# Altium schematic sheet FE_Channel.SchDoc
size 420 x 297 mm
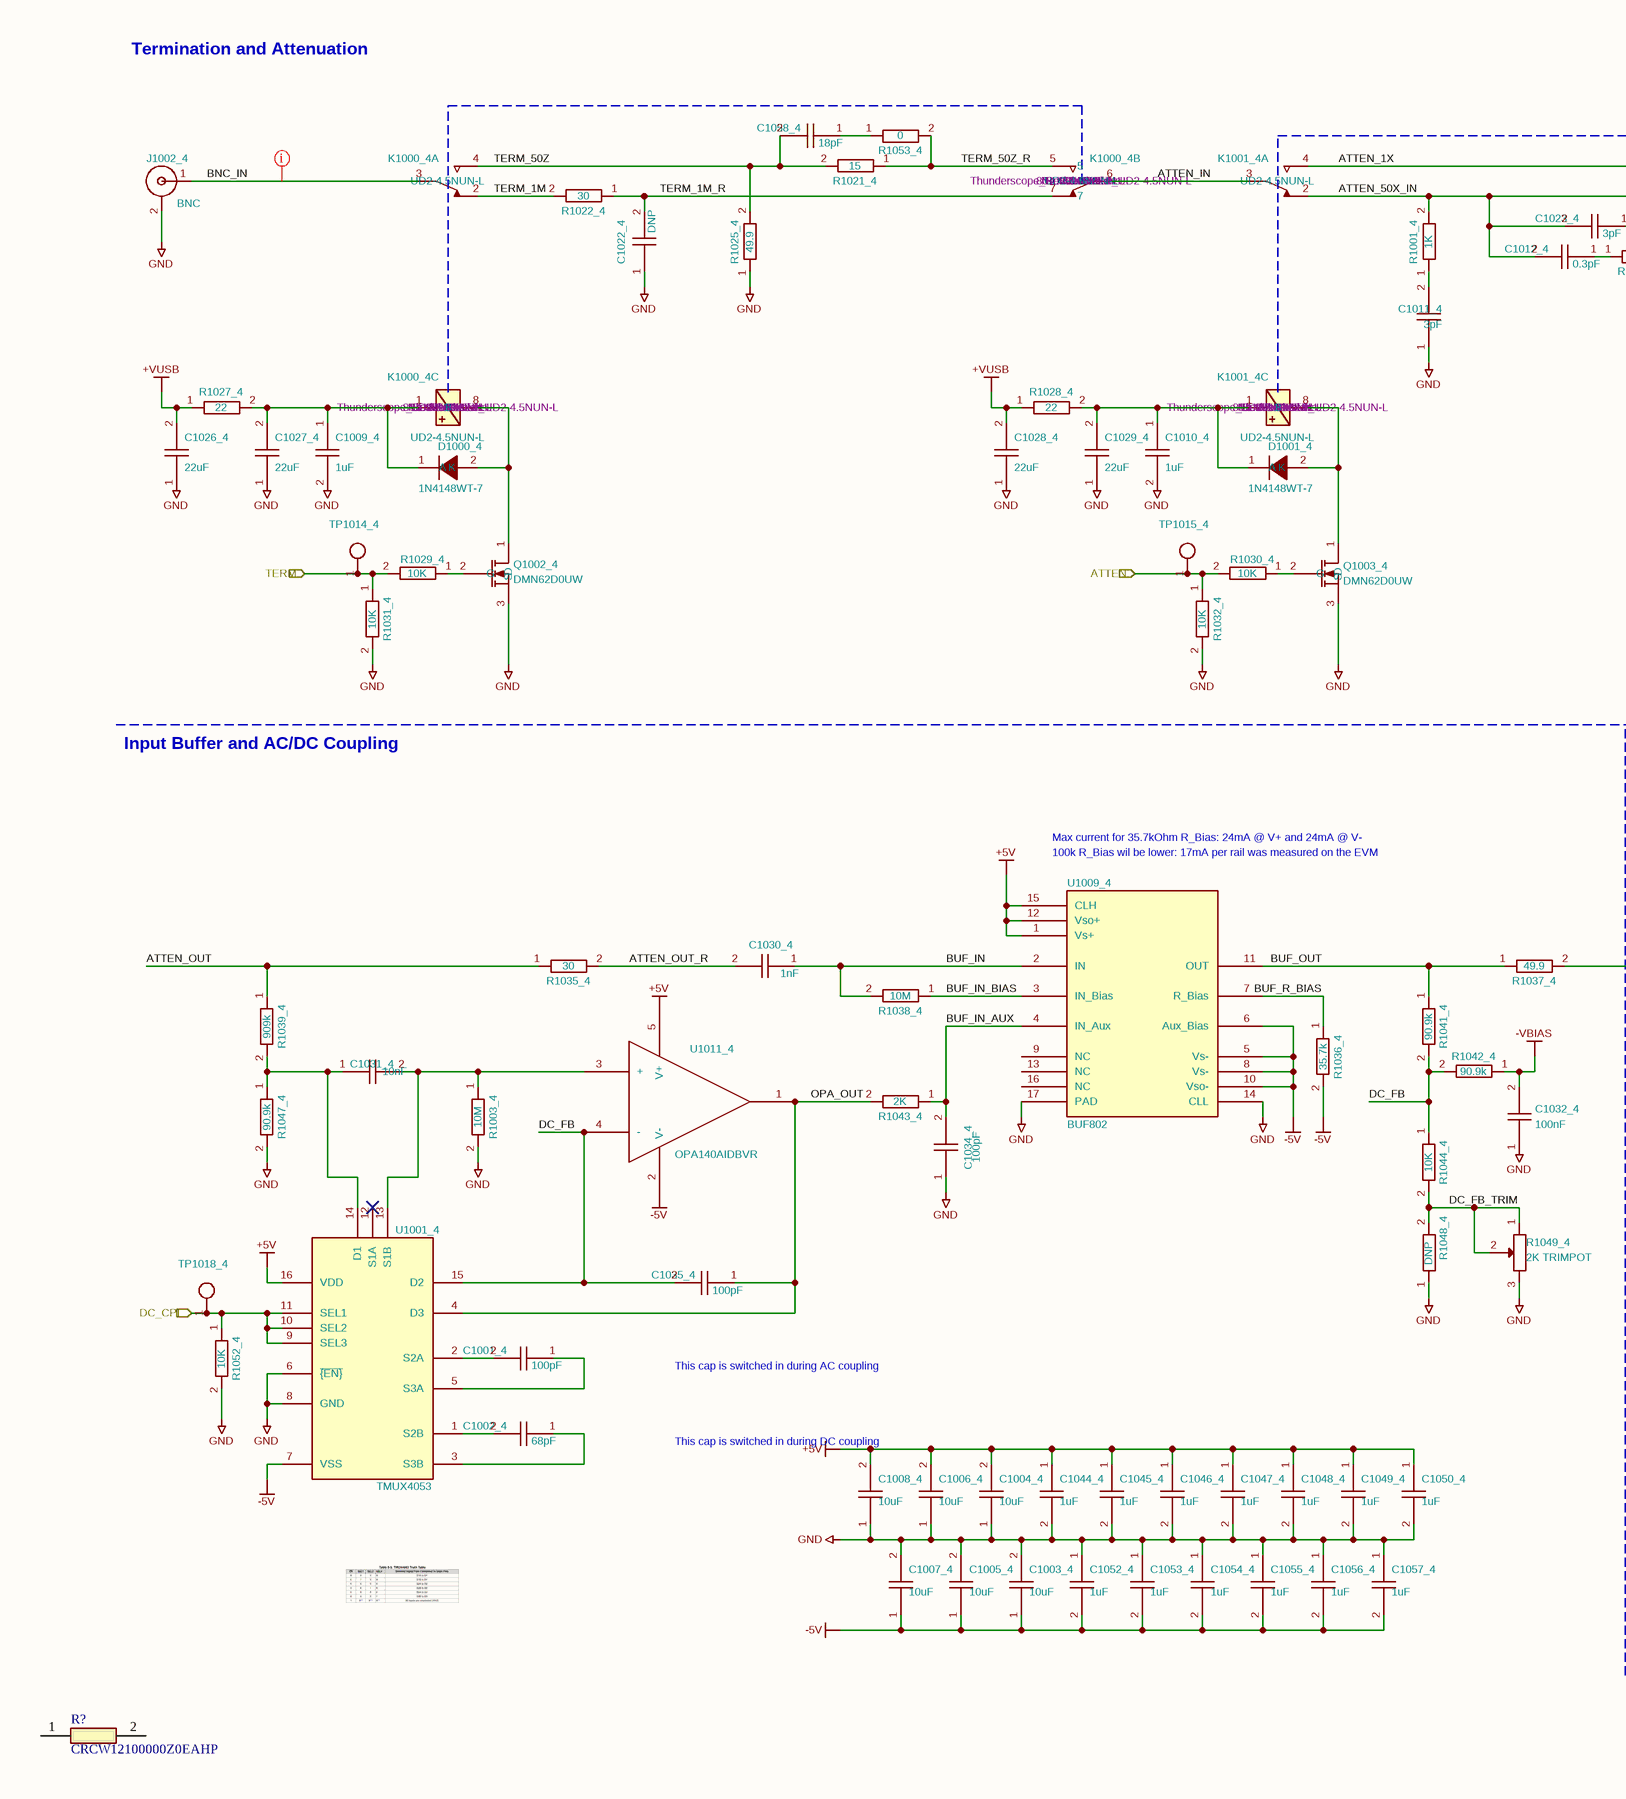
[diagram p0: FE_Channel.SchDoc, left]
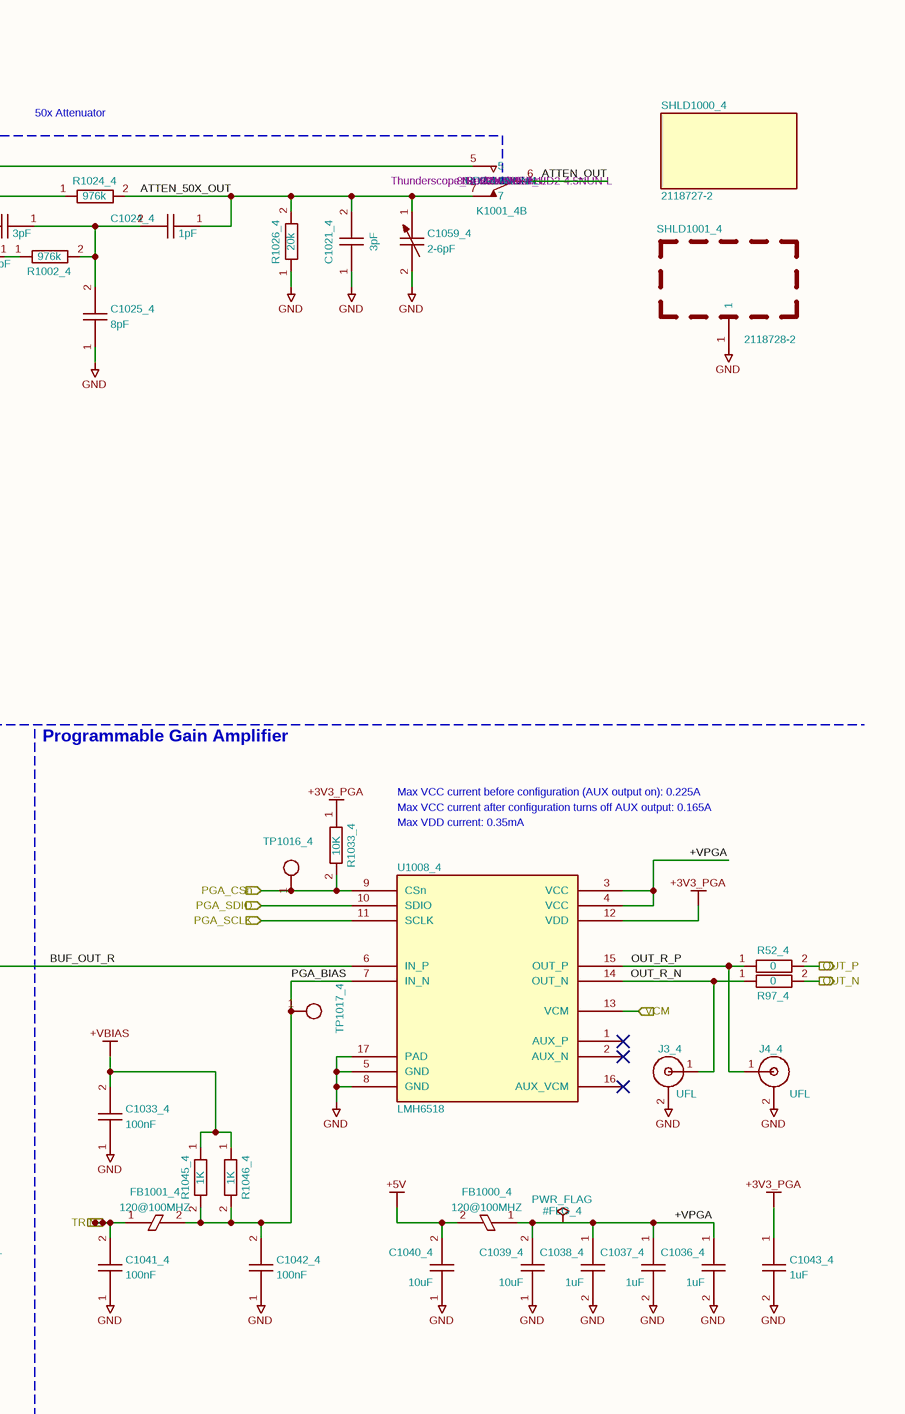
[diagram p1: FE_Channel.SchDoc, right]

## Parts
#FLG_4  PWR_FLAG  (graphical)
C1001_4  100pF  [GEN_C_0402]
C1002_4  68pF  [GEN_C_0402]
C1003_4  10uF  [GEN_C_0603]
C1004_4  10uF  [GEN_C_0603]
C1005_4  10uF  [GEN_C_0603]
C1006_4  10uF  [GEN_C_0603]
C1007_4  10uF  [GEN_C_0603]
C1008_4  10uF  [GEN_C_0603]
C1009_4  1uF  [GEN_C_0402]
C1010_4  1uF  [GEN_C_0402]
C1011_4  3pF  [GEN_C_0402]
C1012_4  0.3pF  [GEN_C_0402]
C1021_4  3pF  [GEN_C_0402]
C1022_4  DNP  [GEN_C_0603]
C1023_4  3pF  [GEN_C_0402]
C1024_4  1pF  [GEN_C_0402]
C1025_4  8pF  [GEN_C_0402]
C1026_4  22uF  [GEN_C_0805]
C1027_4  22uF  [GEN_C_0805]
C1028_4  22uF  [GEN_C_0805]
C1029_4  22uF  [GEN_C_0805]
C1030_4  1nF  [GEN_C_0603]
C1031_4  10nF  [GEN_C_0603]
C1032_4  100nF  [GEN_C_0402]
C1033_4  100nF  [GEN_C_0402]
C1034_4  100pF  [GEN_C_0402]
C1035_4  100pF  [GEN_C_0402]
C1036_4  1uF  [GEN_C_0402]
C1037_4  1uF  [GEN_C_0402]
C1038_4  1uF  [GEN_C_0402]
C1039_4  10uF  [GEN_C_0603]
C1040_4  10uF  [GEN_C_0603]
C1041_4  100nF  [GEN_C_0402]
C1042_4  100nF  [GEN_C_0402]
C1043_4  1uF  [GEN_C_0402]
C1044_4  1uF  [GEN_C_0402]
C1045_4  1uF  [GEN_C_0402]
C1046_4  1uF  [GEN_C_0402]
C1047_4  1uF  [GEN_C_0402]
C1048_4  1uF  [GEN_C_0402]
C1049_4  1uF  [GEN_C_0402]
C1050_4  1uF  [GEN_C_0402]
C1052_4  1uF  [GEN_C_0402]
C1053_4  1uF  [GEN_C_0402]
C1054_4  1uF  [GEN_C_0402]
C1055_4  1uF  [GEN_C_0402]
C1056_4  1uF  [GEN_C_0402]
C1057_4  1uF  [GEN_C_0402]
C1058_4  18pF  [GEN_C_0402]
C1059_4  2-6pF  [EW_TRIMCAP]
D1000_4  1N4148WT-7  [GEN_SOD_523]
D1001_4  1N4148WT-7  [GEN_SOD_523]
FB1000_4  120@100MHZ  [GEN_R_0402]
FB1001_4  120@100MHZ  [GEN_R_0402]
J3_4  UFL  [TE_2334884-1]
J4_4  UFL  [TE_2334884-1]
J1002_4  BNC  [DOSIN-801-0072]
K1000_4  UD2-4.5NUN-L  [KEMET_UD2-4.5NUN-L]  (parts A,B,C of 3)
K1001_4  UD2-4.5NUN-L  [KEMET_UD2-4.5NUN-L]  (parts A,B,C of 3)
Q1002_4  DMN62D0UW  [GEN_SOT_323]
Q1003_4  DMN62D0UW  [GEN_SOT_323]
R52_4  0  [GEN_R_0402]
R97_4  0  [GEN_R_0402]
R1001_4  1K  [GEN_R_0402]
R1002_4  976k  [GEN_R_0402]
R1003_4  10M  [GEN_R_0603]
R1021_4  15  [GEN_R_0603]
R1022_4  30  [GEN_R_0603]
R1024_4  976k  [GEN_R_0402]
R1025_4  49.9  [GEN_R_1206]
R1026_4  20k  [GEN_R_0402]
R1027_4  22  [GEN_R_0603]
R1028_4  22  [GEN_R_0603]
R1029_4  10K  [GEN_R_0402]
R1030_4  10K  [GEN_R_0402]
R1031_4  10K  [GEN_R_0402]
R1032_4  10K  [GEN_R_0402]
R1033_4  10K  [GEN_R_0402]
R1035_4  30  [GEN_R_0603]
R1036_4  35.7k  [GEN_R_0402]
R1037_4  49.9  [GEN_R_0402]
R1038_4  10M  [GEN_R_0603]
R1039_4  909k  [GEN_R_0402]
R1041_4  90.9k  [GEN_R_0402]
R1042_4  90.9k  [GEN_R_0402]
R1043_4  2K  [GEN_R_0402]
R1044_4  10K  [GEN_R_0402]
R1045_4  1K  [GEN_R_0402]
R1046_4  1K  [GEN_R_0402]
R1047_4  90.9k  [GEN_R_0402]
R1048_4  DNP  [GEN_R_0402]
R1049_4  2K TRIMPOT  [BOU_3mm_POT]
R1052_4  10K  [GEN_R_0402]
R1053_4  0  [GEN_R_0402]
R?  CRCW12100000Z0EAHP  [RESC3225X70N]
SHLD1000_4  2118727-2  (mechanical)
SHLD1001_4  2118728-2  [TE_2118728-2]
TP1014_4  PCB  [GEN_TP_PCB]  (value not drawn)
TP1015_4  PCB  [GEN_TP_PCB]  (value not drawn)
TP1016_4  PCB  [GEN_TP_PCB]  (value not drawn)
TP1017_4  PCB  [GEN_TP_PCB]  (value not drawn)
TP1018_4  PCB  [GEN_TP_PCB]  (value not drawn)
U1001_4  TMUX4053  [TI_TSOT-23-16_DYY0016A]
U1008_4  LMH6518  [TI_WQFN_RGH0016A]
U1009_4  BUF802  [TI_VQFN_RGT0016C]
U1011_4  OPA140AIDBVR  [GEN_SOT23_5_950_2900X1600X1450]

## Ports
ATTEN (in), DC_CPL (in), OUT_N (out), OUT_P (out), PGA_CSn (in), PGA_SCLK (in), PGA_SDIO (in), TERM (in), TRIM (in), VCM (in)

## Nets
+3V3_PGA: C1043_4.1 R1033_4.1 U1008_4.12(VDD)
+5V: C1004_4.2 C1006_4.2 C1008_4.2 C1040_4.2 C1044_4.1 C1045_4.1 C1046_4.1 C1047_4.1 C1048_4.1 C1049_4.1 C1050_4.1 FB1000_4.2 U1001_4.16(VDD) U1009_4.1(Vs+) U1009_4.12(Vso+) U1009_4.15(CLH) U1011_4.5(V+)
+VBIAS: C1033_4.2 R1045_4.1 R1046_4.1
+VUSB: C1026_4.2 C1028_4.2 R1027_4.1 R1028_4.1
-5V: C1003_4.1 C1005_4.1 C1007_4.1 C1052_4.2 C1053_4.2 C1054_4.2 C1055_4.2 C1056_4.2 C1057_4.2 R1036_4.2 U1001_4.7(VSS) U1009_4.5(Vs-) U1009_4.6(Aux_Bias) U1009_4.8(Vs-) U1009_4.10(Vso-) U1011_4.2(V-)
-VBIAS: C1032_4.2 R1042_4.1
GND: C1003_4.2 C1004_4.1 C1005_4.2 C1006_4.1 C1007_4.2 C1008_4.1 C1009_4.2 C1010_4.2 C1011_4.1 C1021_4.1 C1022_4.1 C1025_4.1 C1026_4.1 C1027_4.1 C1028_4.1 C1029_4.1 C1032_4.1 C1033_4.1 C1034_4.1 C1036_4.2 C1037_4.2 C1038_4.2 C1039_4.1 C1040_4.1 C1041_4.1 C1042_4.1 C1043_4.2 C1044_4.2 C1045_4.2 C1046_4.2 C1047_4.2 C1048_4.2 C1049_4.2 C1050_4.2 C1052_4.1 C1053_4.1 C1054_4.1 C1055_4.1 C1056_4.1 C1057_4.1 C1059_4.2 J3_4.2(SHIELD) J4_4.2(SHIELD) J1002_4.2(SHIELD) Q1002_4.3(S) Q1003_4.3(S) R1003_4.2 R1025_4.1 R1026_4.1 R1031_4.2 R1032_4.2 R1047_4.2 R1048_4.1 R1049_4.3 R1052_4.2 SHLD1001_4.1 U1001_4.6(~{{EN}}) U1001_4.8(GND) U1008_4.5(GND) U1008_4.8(GND) U1008_4.17(PAD) U1009_4.14(CLL) U1009_4.17(PAD)
+VPGA: #FLG_4.1 C1036_4.1 C1037_4.1 C1038_4.1 C1039_4.2 FB1000_4.1 U1008_4.3(VCC) U1008_4.4(VCC)
ATTEN: R1030_4.2 R1032_4.1 TP1015_4.1 ; port ATTEN
ATTEN_1X: K1001_4.4 K1001_4.5
ATTEN_50X_IN: C1012_4.2 C1023_4.2 K1001_4.2 R1001_4.2 R1024_4.1
ATTEN_50X_OUT: C1021_4.2 C1024_4.1 C1059_4.1 K1001_4.7 R1024_4.2 R1026_4.2
ATTEN_IN: K1000_4.6 K1001_4.3
ATTEN_OUT: K1001_4.6 R1035_4.1 R1039_4.1
ATTEN_OUT_R: C1030_4.2 R1035_4.2
BNC_IN: J1002_4.1(Signal) K1000_4.3
BUF_IN: C1030_4.1 R1038_4.2 U1009_4.2(IN)
BUF_IN_AUX: C1034_4.2 R1043_4.1 U1009_4.4(IN_Aux)
BUF_IN_BIAS: R1038_4.1 U1009_4.3(IN_Bias)
BUF_OUT: R1037_4.1 R1041_4.1 U1009_4.11(OUT)
BUF_OUT_R: R1037_4.2 U1008_4.6(IN_P)
BUF_R_BIAS: R1036_4.1 U1009_4.7(R_Bias)
DC_CPL: R1052_4.1 TP1018_4.1 U1001_4.9(SEL3) U1001_4.10(SEL2) U1001_4.11(SEL1) ; port DC_CPL
DC_FB: C1035_4.2 R1041_4.2 R1042_4.2 R1044_4.1 U1001_4.15(D2) U1011_4.4(-)
DC_FB_TRIM: R1044_4.2 R1048_4.2 R1049_4.1 R1049_4.2
OPA_OUT: C1035_4.1 R1043_4.2 U1001_4.4(D3) U1011_4.1(OUT)
OUT_N: R97_4.2 ; port OUT_N
OUT_P: R52_4.2 ; port OUT_P
OUT_R_N: J3_4.1(Signal) R97_4.1 U1008_4.14(OUT_N)
OUT_R_P: J4_4.1(Signal) R52_4.1 U1008_4.15(OUT_P)
PGA_BIAS: C1042_4.2 FB1001_4.2 R1045_4.2 R1046_4.2 TP1017_4.1 U1008_4.7(IN_N)
PGA_CSn: R1033_4.2 TP1016_4.1 U1008_4.9(CSn) ; port PGA_CSn
PGA_SCLK: U1008_4.11(SCLK) ; port PGA_SCLK
PGA_SDIO: U1008_4.10(SDIO) ; port PGA_SDIO
TERM: R1029_4.2 R1031_4.1 TP1014_4.1 ; port TERM
TERM_1M: K1000_4.2 R1022_4.2
TERM_1M_R: C1022_4.2 K1000_4.7 R1022_4.1
TERM_50Z: C1058_4.2 K1000_4.4 R1021_4.2 R1025_4.2
TERM_50Z_R: K1000_4.5 R1021_4.1 R1053_4.2
TRIM: C1041_4.2 FB1001_4.1 ; port TRIM
VCM: U1008_4.13(VCM) ; port VCM
NetC1001_4_1: C1001_4.1 U1001_4.5(S3A)
NetC1001_4_2: C1001_4.2 U1001_4.2(S2A)
NetC1002_4_1: C1002_4.1 U1001_4.3(S3B)
NetC1002_4_2: C1002_4.2 U1001_4.1(S2B)
NetC1009_4_1: C1009_4.1 C1027_4.2 D1000_4.1(K) K1000_4.1 R1027_4.2
NetC1010_4_1: C1010_4.1 C1029_4.2 D1001_4.1(K) K1001_4.1 R1028_4.2
NetC1011_4_2: C1011_4.2 R1001_4.1
NetC1012_4_1: C1012_4.1 R1002_4.1
NetC1023_4_1: C1023_4.1 C1024_4.2 C1025_4.2 R1002_4.2
NetC1031_4_1: C1031_4.1 R1039_4.2 R1047_4.1 U1001_4.14(D1)
NetC1031_4_2: C1031_4.2 R1003_4.1 U1001_4.13(S1B) U1011_4.3(+)
NetC1058_4_1: C1058_4.1 R1053_4.1
NetD1000_4_2: D1000_4.2(A) K1000_4.8 Q1002_4.1(D)
NetD1001_4_2: D1001_4.2(A) K1001_4.8 Q1003_4.1(D)
NetQ1002_4_2: Q1002_4.2(G) R1029_4.1
NetQ1003_4_2: Q1003_4.2(G) R1030_4.1

Not connected (* = marked no-connect by the designer): R? 1 2; U1001_4 12(S1A)*; U1008_4 1(AUX_P)* 2(AUX_N)* 16(AUX_VCM)*; U1009_4 9(NC) 13(NC) 16(NC)

## Layout directives
net class 50Z: BNC_IN

## Notes on the sheet
- Termination and Attenuation
- 50x Attenuator
- Input Buffer and AC/DC Coupling
- Programmable Gain Amplifier
- Max current for 35.7kOhm R_Bias: 24mA @ V+ and 24mA @ V-
- (near U1009_4) 100k R_Bias wil be lower: 17mA per rail was measured on the EVM
- Max VDD current: 0.35mA
- Max VCC current before configuration (AUX output on): 0.225A
- Max VCC current after configuration turns off AUX output: 0.165A
- This cap is switched in
  during AC coupling
- This cap is switched in
  during DC coupling
- 1
- 2
- 3
- 4
- 5
- 6
- 7
- 8
- A
- B
- C
- D
- E
- Aleksa Bjelogrlic
- Title: ThunderScope
- File: FE_Channel.kicad_sch
- Sheet: /
- EEVengers
- F
- KiCad E.D.A.  kicad (5.1.4)-1
- Size: A3
- Date:
- Rev: 5.3
- Id: 1/1

## Library data of the parts
C1001_4 C1034_4 C1035_4 = CAP 100pF 50V C0G 0402: MANUFACTURER: Murata; MANUFACTURER PART NUMBER: GCM1555C1H101FA16D; TEMPERATURE COEFFICIENT: C0G; VOLTAGE RATING: 50V; Substitutions Policy: Any Parametric Equivalent; PACKAGE: 0402; SUPPLIER 1: Mouser; SUPPLIER PART NUMBER 1: 81-GCM1555C1H101FA6D; Value: 100pF; Footprint: Thunderscope_Rev5:GEN_C_0402
C1002_4 = CAP 68pF 50V C0G 0402: MANUFACTURER: Murata; MANUFACTURER PART NUMBER: GCM1555C1H680FA16J; TEMPERATURE COEFFICIENT: C0G; VOLTAGE RATING: 50V; Substitutions Policy: Any Parametric Equivalent; PACKAGE: 0402; SUPPLIER 1: Mouser; SUPPLIER PART NUMBER 1: 81-GCM1555C1H680FA6J; Value: 68pF; Footprint: Thunderscope_Rev5:GEN_C_0402
C1003_4 C1004_4 C1005_4 C1006_4 C1007_4 C1008_4 C1039_4 C1040_4 = CAP 10uF 25V X5R 0603: MANUFACTURER: Murata; MANUFACTURER PART NUMBER: GRM188R61E106MA73D; VOLTAGE RATING: 25V; Substitutions Policy: Any Parametric Equivalent; PACKAGE: 0402; SUPPLIER 1: Mouser; SUPPLIER PART NUMBER 1: 81-GRM188R61E106MA3D; Value: 10uF; Footprint: Thunderscope_Rev5:GEN_C_0603
C1009_4 C1010_4 C1036_4 C1037_4 C1038_4 C1043_4 C1044_4 C1045_4 C1046_4 C1047_4 C1048_4 C1049_4 C1050_4 C1052_4 C1053_4 C1054_4 C1055_4 C1056_4 C1057_4 = CAP 1uF 25V X5R 0402: MANUFACTURER: Murata; MANUFACTURER PART NUMBER: GRM155R61E105KA12D; VOLTAGE RATING: 25V; Substitutions Policy: Any Parametric Equivalent; PACKAGE: 0402; SUPPLIER 1: Mouser; SUPPLIER PART NUMBER 1: 81-GRM155R61E105KA2D; Value: 1uF; Footprint: Thunderscope_Rev5:GEN_C_0402
C1011_4 C1023_4 = CAP 3pF 200V C0G 0402: MANUFACTURER: KEMET; MANUFACTURER PART NUMBER: CBR04C309B2GAC; VOLTAGE RATING: 200V; Substitutions Policy: No Substitutions; TEMPERATURE COEFFICIENT: C0G; PACKAGE: 0402; SUPPLIER 1: Mouser; SUPPLIER PART NUMBER 1: 80-CBR04C309B2GAC; Value: 3pF; Footprint: Thunderscope_Rev5:GEN_C_0402
C1012_4 = CAP 0.3pF 100V Thin Film 0402: MANUFACTURER: KYOCERA AVX; MANUFACTURER PART NUMBER: 04021J0R3ZBSTR; VOLTAGE RATING: 100V; Substitutions Policy: No Substitutions; PACKAGE: 0402; SUPPLIER 1: Mouser; SUPPLIER PART NUMBER 1: 581-04021J0R3ZBSTR; Value: 0.3pF; Footprint: Thunderscope_Rev5:GEN_C_0402
C1021_4 = CAP 3pF 200V C0G 0402: MANUFACTURER: KEMET; MANUFACTURER PART NUMBER: CBR04C309B2GAC; VOLTAGE RATING: 200V; TEMPERATURE COEFFICIENT: C0G; Substitutions Policy: No Substitutions; PACKAGE: 0402; SUPPLIER 1: Mouser; SUPPLIER PART NUMBER 1: 80-CBR04C309B2GAC; Value: 3pF; Footprint: Thunderscope_Rev5:GEN_C_0402
C1022_4 = CAP DNP 0603: PACKAGE: 0603; Value: DNP; Footprint: Thunderscope_Rev5:GEN_C_0603
C1024_4 = CAP 1pF 50V C0G 0402: MANUFACTURER: KEMET; MANUFACTURER PART NUMBER: CBR04C109A5GAC; VOLTAGE RATING: 50V; Substitutions Policy: No Substitutions; PACKAGE: 0402; SUPPLIER 1: Mouser; SUPPLIER PART NUMBER 1: 80-CBR04C109A5GAC; Value: 1pF; Footprint: Thunderscope_Rev5:GEN_C_0402
C1025_4 = CAP 8pF 50V C0G 0402: MANUFACTURER: KEMET; MANUFACTURER PART NUMBER: CBR04C809B5GAC; VOLTAGE RATING: 50V; TEMPERATURE COEFFICIENT: C0G; Substitutions Policy: No Substitutions; PACKAGE: 0402; SUPPLIER 1: Mouser; SUPPLIER PART NUMBER 1: 80-CBR04C809B5GAC; Value: 8pF; Footprint: Thunderscope_Rev5:GEN_C_0402
C1026_4 C1027_4 C1028_4 C1029_4 = CAP 22uF 25V X5R 0805: HOUSE PART NUMBER: C-22uF-0805-002; MANUFACTURER: Murata; MANUFACTURER PART NUMBER: GRM21BR61E226ME44L; VOLTAGE RATING: 25V; Substitutions Policy: Any Parametric Equivalent; PACKAGE: 0805; SUPPLIER 1: Mouser; SUPPLIER PART NUMBER 1: 81-GRM21BR61E226ME4L; Value: 22uF; Footprint: Thunderscope_Rev5:GEN_C_0805
C1030_4 = CAP 1nF 100V C0G 0603: MANUFACTURER: Murata; MANUFACTURER PART NUMBER: GCM1885C2A102FA16D; VOLTAGE RATING: 100V; TEMPERATURE COEFFICIENT: C0G; Substitutions Policy: ECO Required for Substitution; PACKAGE: 0603; SUPPLIER 1: Mouser; SUPPLIER PART NUMBER 1: 81-GCM1885C2A102FA6D; Value: 1nF; Footprint: Thunderscope_Rev5:GEN_C_0603
C1031_4 = CAP 10nF 50V C0G 0603: MANUFACTURER: Murata; MANUFACTURER PART NUMBER: GRM1885C1H103JA01J; VOLTAGE RATING: 50V; Substitutions Policy: ECO Required for Substitution; PACKAGE: 0603; SUPPLIER 1: Mouser; SUPPLIER PART NUMBER 1: 81-GRM1885C1H103JA1J; Value: 10nF; Footprint: Thunderscope_Rev5:GEN_C_0603
C1032_4 C1033_4 C1041_4 C1042_4 = CAP 100nF 16V X7R 0402: HOUSE PART NUMBER: C-100nF-0402-002; MANUFACTURER: Murata; MANUFACTURER PART NUMBER: GCM155R71C104KA55D; VOLTAGE RATING: 16V; Substitutions Policy: Any Parametric Equivalent; PACKAGE: 0402; SUPPLIER 1: Mouser; SUPPLIER PART NUMBER 1: 81-GCM155R71C104KA5D; Value: 100nF; Footprint: Thunderscope_Rev5:GEN_C_0402
C1058_4 = CAP 18pF 50V C0G 0402: MANUFACTURER: KEMET; MANUFACTURER PART NUMBER: CBR04C180F5GAC; VOLTAGE RATING: 50V; TEMPERATURE COEFFICIENT: C0G; Substitutions Policy: No Substitutions; PACKAGE: 0402; SUPPLIER 1: Mouser; SUPPLIER PART NUMBER 1: 80-CBR04C180F5G; Value: 18pF; Footprint: Thunderscope_Rev5:GEN_C_0402
C1059_4 = CAP TRIMMER 2-6PF 100V: MANUFACTURER: EW Electronics; MANUFACTURER PART NUMBER: SGC3S060; Substitutions Policy: ECO Required for Substitution; SUPPLIER 1: Digikey; SUPPLIER PART NUMBER 1: 2447-SGC3S060CT-ND; PACKAGE: 2-SMD (4.5x3.2mm); Value: 2-6pF; Footprint: Thunderscope_Rev5:EW_TRIMCAP
D1000_4 D1001_4 = DIODE 1N4148: MANUFACTURER: Diodes; Substitutions Policy: ECO Required for Substitution; SUPPLIER 1: Mouser; SUPPLIER PART NUMBER 1: 621-1N4148WT; MANUFACTURER PART NUMBER: 1N4148WT-7; PACKAGE: SOD-523; Value: 1N4148WT-7; Footprint: Thunderscope_Rev5:GEN_SOD_523
FB1000_4 FB1001_4 = FERRITE BEAD 120 OHM 0402: HOUSE PART NUMBER: BLM15PX121SN1D; MANUFACTURER: Murata; Substitutions Policy: No Substitutions; SUPPLIER 1: Mouser; SUPPLIER PART NUMBER 1: 81-BLM15PX121SN1D; MANUFACTURER PART NUMBER: BLM15PX121SN1D; PACKAGE: 0402; Value: 120@100MHZ; Footprint: Thunderscope_Rev5:GEN_R_0402
J3_4 J4_4 = UFL Jack SMD: MANUFACTURER: TE Connectivity; MANUFACTURER PART NUMBER: 2334884-1; SUPPLIER 1: Mouser; SUPPLIER PART NUMBER 1: 571-2334884-1; PACKAGE: Surface Mount; Value: UFL; Footprint: Thunderscope_Rev5:TE_2334884-1
J1002_4 = BNC JACK R/A: MANUFACTURER: Molex; MANUFACTURER PART NUMBER: 73100-0105; Substitutions Policy: No Substitutions; SUPPLIER 1: Mouser; SUPPLIER PART NUMBER 1: 538-73100-0105; PACKAGE: Through Hole; Value: BNC; Footprint: Thunderscope_Rev5:MOL_0731000105
K1000_4 K1001_4 = RELAY DPDT-NO UD2-4.5NUN-L: MANUFACTURER: KEMET; Substitutions Policy: No Substitutions; MANUFACTURER PART NUMBER: UD2-4.5NUN-L; SUPPLIER 1: Mouser; SUPPLIER PART NUMBER 1: 80-UD2-4.5NUN-L; PACKAGE: Surface Mount; Value: UD2-4.5NUN-L; Footprint: Thunderscope_Rev5:KEMET_UD2-4.5NUN-L
Q1002_4 Q1003_4 = NMOS DMN62D0UW: HOUSE PART NUMBER: DMN62D0UW-7; MANUFACTURER: Diodes; VDSS: 60V; Substitutions Policy: ECO Required for Substitution; SUPPLIER 1: Mouser; SUPPLIER PART NUMBER 1: 621-DMN62D0UW-7; MANUFACTURER PART NUMBER: DMN62D0UW-7; PACKAGE: SOT-323; Value: DMN62D0UW; Footprint: Thunderscope_Rev5:GEN_SOT_323
R52_4 R97_4 R1053_4 = RES 0 OHM 1/16W 0402: MANUFACTURER: Yageo; MANUFACTURER PART NUMBER: RC0402JR-070RL; Substitutions Policy: Any Parametric Equivalent; PACKAGE: 0402; SUPPLIER 1: Mouser; SUPPLIER PART NUMBER 1: 603-RC0402JR-070RL; Value: 0; Footprint: Thunderscope_Rev5:GEN_R_0402
R1001_4 R1045_4 R1046_4 = RES 1K OHM 1% 1/10W 0402: HOUSE PART NUMBER: R-1K-0402-1%-001; MANUFACTURER: Yageo; MANUFACTURER PART NUMBER: RC0402FR-071KL; TOLERANCE: 1%; Substitutions Policy: Any Parametric Equivalent; PACKAGE: 0402; SUPPLIER 1: Mouser; SUPPLIER PART NUMBER 1: 603-RC0402FR-071KL; Value: 1K; Footprint: Thunderscope_Rev5:GEN_R_0402
R1002_4 R1024_4 = RES 976k OHM 1% 1/10W 0402: MANUFACTURER: KOA Speer; MANUFACTURER PART NUMBER: RK73H1ETTP9763F; TOLERANCE: 1%; Substitutions Policy: ECO Required for Substitution; PACKAGE: 0402; SUPPLIER 1: Mouser; SUPPLIER PART NUMBER 1: 660-RK73H1ETTP9763F; Value: 976k; Footprint: Thunderscope_Rev5:GEN_R_0402
R1003_4 R1038_4 = RES 10M OHM 1% 1/10W 0603: MANUFACTURER: KOA Speer; MANUFACTURER PART NUMBER: RK73H1JTTD1005F; TOLERANCE: 1%; Substitutions Policy: No Substitutions; PACKAGE: 0603; SUPPLIER 1: Mouser; SUPPLIER PART NUMBER 1: 660-RK73H1JTTD1005F; Value: 10M; Footprint: Thunderscope_Rev5:GEN_R_0603
R1021_4 = RES 15 OHM 1% 1/3W 0603: MANUFACTURER: KOA Speer; MANUFACTURER PART NUMBER: SG73P1JTTD15R0F; TOLERANCE: 1%; Substitutions Policy: No Substitutions; PACKAGE: 0603; SUPPLIER 1: Mouser; SUPPLIER PART NUMBER 1: 660-SG73P1JTTD15R0F; Value: 15; Footprint: Thunderscope_Rev5:GEN_R_0603
R1022_4 R1035_4 = RES 30 OHM 1% 1/3W 0603: MANUFACTURER: KOA Speer; MANUFACTURER PART NUMBER: SG73P1JTTD30R0F; TOLERANCE: 1%; Substitutions Policy: No Substitutions; PACKAGE: 0603; SUPPLIER 1: Mouser; SUPPLIER PART NUMBER 1: 660-SG73P1JTTD30R0F; Value: 30; Footprint: Thunderscope_Rev5:GEN_R_0603
R1025_4 = RES 49.9 OHM 1% 1W 0508: MANUFACTURER: KOA Speer; MANUFACTURER PART NUMBER: WK73R2ATTD49R9F; TOLERANCE: 1%; POWER RATING: 1W; Substitutions Policy: No Substitutions; PACKAGE: 0508; SUPPLIER 1: Mouser; SUPPLIER PART NUMBER 1: 660-WK73R2ATTD49R9F; Value: 49.9; Footprint: Thunderscope_Rev5:GEN_R_0508
R1026_4 = RES 20K OHM 1% 1/16W 0402: MANUFACTURER: Yageo; MANUFACTURER PART NUMBER: RC0402FR-0720KL; TOLERANCE: 1%; Substitutions Policy: Any Parametric Equivalent; PACKAGE: 0402; SUPPLIER 1: Mouser; SUPPLIER PART NUMBER 1: 603-RC0402FR-0720KL; Value: 20k; Footprint: Thunderscope_Rev5:GEN_R_0402
R1027_4 R1028_4 = RES 22 OHM 1% 1/3W 0603: MANUFACTURER: KOA Speer; MANUFACTURER PART NUMBER: SG73P1JTTD22R0F; TOLERANCE: 1%; Substitutions Policy: No Substitutions; PACKAGE: 0603; SUPPLIER 1: Mouser; SUPPLIER PART NUMBER 1: 660-SG73P1JTTD22R0F; Value: 22; Footprint: Thunderscope_Rev5:GEN_R_0603
R1029_4 R1030_4 R1031_4 R1032_4 R1033_4 R1044_4 R1052_4 = RES 10K OHM 1% 1/16W 0402: MANUFACTURER: Yageo; MANUFACTURER PART NUMBER: RC0402FR-0710KL; TOLERANCE: 1%; Substitutions Policy: Any Parametric Equivalent; PACKAGE: 0402; SUPPLIER 1: Mouser; SUPPLIER PART NUMBER 1: 603-RC0402FR-0710KL; Value: 10K; Footprint: Thunderscope_Rev5:GEN_R_0402
R1036_4 = RES 35.7K OHM 1% 1/16W 0402: MANUFACTURER: Yageo; MANUFACTURER PART NUMBER: RC0402FR-0735K7L; TOLERANCE: 1%; Substitutions Policy: Any Parametric Equivalent; PACKAGE: 0402; SUPPLIER 1: Mouser; SUPPLIER PART NUMBER 1: 603-RC0402FR-0735K7L; Value: 35.7k; Footprint: Thunderscope_Rev5:GEN_R_0402
R1037_4 = RES 49.9 OHM 1% 1/10W 0402: MANUFACTURER: Yageo; MANUFACTURER PART NUMBER: RC0402FR-0749R9L; TOLERANCE: 1%; Substitutions Policy: Any Parametric Equivalent; PACKAGE: 0402; SUPPLIER 1: Mouser; SUPPLIER PART NUMBER 1: 603-RC0402FR-0749R9L; Value: 49.9; Footprint: Thunderscope_Rev5:GEN_R_0402
R1039_4 = RES 909K OHM 1% 1/16W 0402: MANUFACTURER: Yageo; MANUFACTURER PART NUMBER: RC0402FR-07909KL; TOLERANCE: 1%; Substitutions Policy: Any Parametric Equivalent; PACKAGE: 0402; SUPPLIER 1: Mouser; SUPPLIER PART NUMBER 1: 603-RC0402FR-07909KL; Value: 909k; Footprint: Thunderscope_Rev5:GEN_R_0402
R1041_4 R1042_4 R1047_4 = RES 90.9K OHM 1% 1/16W 0402: MANUFACTURER: Yageo; MANUFACTURER PART NUMBER: RC0402FR-0790K9L; TOLERANCE: 1%; Substitutions Policy: Any Parametric Equivalent; PACKAGE: 0402; SUPPLIER 1: Mouser; SUPPLIER PART NUMBER 1: 603-RC0402FR-0790K9L; Value: 90.9k; Footprint: Thunderscope_Rev5:GEN_R_0402
R1043_4 = RES 2K OHM 1% 1/16W 0402: MANUFACTURER: Yageo; MANUFACTURER PART NUMBER: RC0402FR-072KL; TOLERANCE: 1%; Substitutions Policy: Any Parametric Equivalent; PACKAGE: 0402; SUPPLIER 1: Mouser; SUPPLIER PART NUMBER 1: 603-RC0402FR-072KL; Value: 2K; Footprint: Thunderscope_Rev5:GEN_R_0402
R1048_4 = RES DNP 0402: TOLERANCE: 1%; PACKAGE: 0402; Value: DNP; Footprint: Thunderscope_Rev5:GEN_R_0402
R1049_4 = TRIMMER 2K OHM 0.1W J LEAD TOP: MANUFACTURER: Bourns; MANUFACTURER PART NUMBER: TC33X-2-202E; TOLERANCE: 1%; Substitutions Policy: ECO Required for Substitution; SUPPLIER 1: Mouser; SUPPLIER PART NUMBER 1: 652-TC33X-2-202E; PACKAGE: 2-SMD (3.8x3.6mm); Value: 2K TRIMPOT; Footprint: Thunderscope_Rev5:BOU_3mm_POT
R? = CRCW12100000Z0EAHP: Resistor; Manufacturer_Name: Vishay; Datasheet Link: http://componentsearchengine.com/Datasheets/1/CRCW12100000Z0EAHP.pdf; Height: 0.7mm; Manufacturer_Part_Number: CRCW12100000Z0EAHP; Mouser Part Number: 71-CRCW12100000Z0EAH; Mouser Price/Stock: https://www.mouser.co.uk/ProductDetail/Vishay-Dale/CRCW12100000Z0EAHP?qs=40TFAHZMFvfh5Vmu%2FUuCPQ%3D%3D; Arrow Part Number: CRCW12100000Z0EAHP; Arrow Price/Stock: https://www.arrow.com/en/products/crcw12100000z0eahp/vishay?utm_currency=USD&region=nac
SHLD1000_4 = SHIELD 2118727-2: MANUFACTURER: TE Connectivity AMP; SUPPLIER 1: Mouser; SUPPLIER PART NUMBER 1: 571-2118727-2; MANUFACTURER PART NUMBER: 2118727-2; Value: 2118727-2
SHLD1001_4 = SHIELD 2118728-2: MANUFACTURER: TE Connectivity; Substitutions Policy: No Substitutions; SUPPLIER 1: Mouser; SUPPLIER PART NUMBER 1: 571-2118728-2; MANUFACTURER PART NUMBER: 2118728-2; PACKAGE: Surface Mount; Value: 2118728-2; Footprint: Thunderscope_Rev5:TE_2118728-2
TP1014_4 TP1015_4 TP1016_4 TP1017_4 TP1018_4 = TP PCB 1mm: Value: PCB; Footprint: Thunderscope_Rev5:GEN_TP_PCB
U1001_4 = IC SWITCH 3X SPDT TMUX4053: MANUFACTURER: Texas Instruments; MANUFACTURER PART NUMBER: TMUX4053DYYR; Substitutions Policy: No Substitutions; SUPPLIER 1: Texas Instruments; SUPPLIER PART NUMBER 1: TMUX4053DYYR; PACKAGE: 16-SOT-23-THIN; Value: TMUX4053; Footprint: Thunderscope_Rev5:TI_TSOT-23-16_DYY0016A
U1008_4 = IC PGA LMH6518: MANUFACTURER: Texas Instruments; MANUFACTURER PART NUMBER: LMH6518SQX/NOPB; Substitutions Policy: No Substitutions; SUPPLIER 1: Texas Instruments; SUPPLIER PART NUMBER 1: LMH6518SQX/NOPB; PACKAGE: 16-WQFN (4x4mm); Value: LMH6518; Footprint: Thunderscope_Rev5:TI_WQFN_RGH0016A
U1009_4 = IC BUFFER AMP BUF802: MANUFACTURER: Texas Instruments; MANUFACTURER PART NUMBER: BUF802IRGTR; Substitutions Policy: No Substitutions; SUPPLIER 1: Texas Instruments; SUPPLIER PART NUMBER 1: BUF802IRGTR; PACKAGE: 16-VQFN (3x3mm); Value: BUF802; Footprint: Thunderscope_Rev5:TI_VQFN_RGT0016C
U1011_4 = IC OPAMP OPA140: MANUFACTURER: Texas Instruments; Substitutions Policy: No Substitutions; SUPPLIER 1: Texas Instruments; SUPPLIER PART NUMBER 1: OPA140AIDBVR; MANUFACTURER PART NUMBER: OPA140AIDBVR; PACKAGE: SOT-23-5; Value: OPA140AIDBVR; Footprint: Thunderscope_Rev5:GEN_SOT23_5_950_2900X1600X1450
#FLG_4 = PWR_FLAG: Value: PWR_FLAG